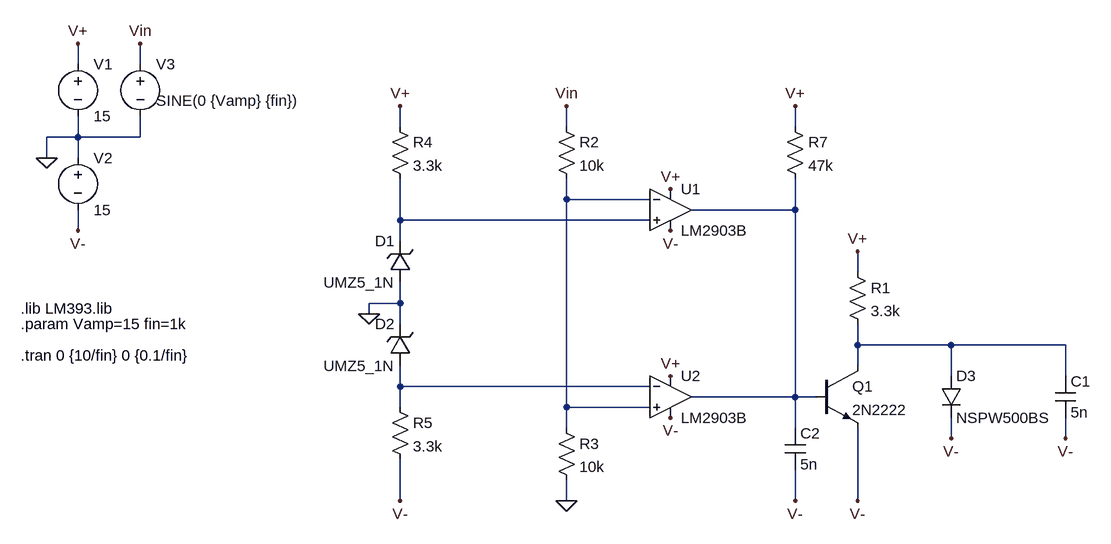
[diagram p0: schematic ClippingLed.asc]
ClippingLed.asc, the LTspice schematic file:
Version 4.1
SHEET 1 3588 2084
WIRE -832 16 -832 -16
WIRE -736 16 -736 -16
WIRE -336 112 -336 80
WIRE -80 112 -80 80
WIRE 272 112 272 80
WIRE -832 128 -832 96
WIRE -832 128 -880 128
WIRE -736 128 -736 96
WIRE -736 128 -832 128
WIRE -880 160 -880 128
WIRE -832 160 -832 128
WIRE -80 224 -80 192
WIRE 48 224 -80 224
WIRE 272 240 272 192
WIRE 272 240 112 240
WIRE -336 256 -336 192
WIRE 48 256 -336 256
WIRE -832 272 -832 240
WIRE -336 288 -336 256
WIRE 368 336 368 304
WIRE -336 384 -336 352
WIRE -336 384 -384 384
WIRE -384 400 -384 384
WIRE -336 416 -336 384
WIRE 368 448 368 416
WIRE 512 448 368 448
WIRE 688 448 512 448
WIRE 368 480 368 448
WIRE 512 496 512 448
WIRE 688 496 688 448
WIRE -336 512 -336 480
WIRE 48 512 -336 512
WIRE 272 528 272 240
WIRE 272 528 112 528
WIRE 304 528 272 528
WIRE -336 544 -336 512
WIRE -80 544 -80 224
WIRE 48 544 -80 544
WIRE -80 576 -80 544
WIRE 272 576 272 528
WIRE 512 592 512 560
WIRE 688 592 688 560
WIRE -336 688 -336 624
WIRE -80 688 -80 656
WIRE 272 688 272 640
WIRE 368 688 368 576
FLAG -832 -16 V+
FLAG -832 272 V-
FLAG -736 -16 Vin
FLAG -80 80 Vin
FLAG -880 160 0
FLAG 80 208 V+
FLAG 80 272 V-
FLAG 80 496 V+
FLAG 80 560 V-
FLAG -80 688 0
FLAG -336 80 V+
FLAG -336 688 V-
FLAG -384 400 0
FLAG 368 304 V+
FLAG 272 80 V+
FLAG 368 688 V-
FLAG 512 592 V-
FLAG 688 592 V-
FLAG 272 688 V-
SYMBOL voltage -832 0 R0
WINDOW 123 0 0 Left 0
WINDOW 39 0 0 Left 0
SYMATTR InstName V1
SYMATTR Value 15
SYMBOL voltage -832 144 R0
WINDOW 123 0 0 Left 0
WINDOW 39 0 0 Left 0
SYMATTR InstName V2
SYMATTR Value 15
SYMBOL voltage -736 0 R0
WINDOW 123 24 44 Left 2
WINDOW 39 0 0 Left 0
WINDOW 3 24 72 Left 2
SYMATTR Value SINE(0 {Vamp} {fin})
SYMATTR InstName V3
SYMBOL OpAmps\\opamp2 80 176 R0
SYMATTR InstName U1
SYMATTR Value LM2903B
SYMBOL OpAmps\\opamp2 80 464 R0
SYMATTR InstName U2
SYMATTR Value LM2903B
SYMBOL res -96 96 R0
SYMATTR InstName R2
SYMATTR Value 10k
SYMBOL res -96 560 R0
SYMATTR InstName R3
SYMATTR Value 10k
SYMBOL zener -320 352 R180
WINDOW 0 24 64 Left 2
WINDOW 3 24 0 Left 2
SYMATTR InstName D1
SYMATTR Value UMZ5_1N
SYMBOL res -352 96 R0
SYMATTR InstName R4
SYMATTR Value 3.3k
SYMBOL res -352 528 R0
SYMATTR InstName R5
SYMATTR Value 3.3k
SYMBOL zener -320 480 R180
WINDOW 0 24 64 Left 2
WINDOW 3 24 0 Left 2
SYMATTR InstName D2
SYMATTR Value UMZ5_1N
SYMBOL npn 304 480 R0
SYMATTR InstName Q1
SYMATTR Value 2N2222
SYMBOL diode 496 496 R0
SYMATTR InstName D3
SYMATTR Value NSPW500BS
SYMATTR Description Diode
SYMATTR Type diode
SYMBOL res 352 320 R0
SYMATTR InstName R1
SYMATTR Value 3.3k
SYMBOL res 256 96 R0
SYMATTR InstName R7
SYMATTR Value 47k
SYMBOL cap 672 496 R0
SYMATTR InstName C1
SYMATTR Value 5n
SYMBOL cap 256 576 R0
SYMATTR InstName C2
SYMATTR Value 5n
TEXT -920 416 Left 2 !.param Vamp=15 fin=1k
TEXT -920 464 Left 2 !.tran 0 {10/fin} 0 {0.1/fin}
TEXT -920 392 Left 2 !.lib LM393.lib

The netlist it stands for:
* ClippingLed.asc
V1 V+ 0 15
V2 0 V- 15
V3 Vin 0 SINE(0 {Vamp} {fin})
X§U1 N003 N001 V+ V- N002 LM2903B  ; pins In+ In- V+ V- OUT
X§U2 N001 N005 V+ V- N002 LM2903B  ; pins In+ In- V+ V- OUT
R2 Vin N001 10k
R3 N001 0 10k
D1 0 N003 UMZ5_1N
R4 V+ N003 3.3k
R5 N005 V- 3.3k
D2 N005 0 UMZ5_1N
Q1 N004 N002 V- 0 2N2222
D3 N004 V- NSPW500BS
R1 V+ N004 3.3k
R7 V+ N002 47k
C1 N004 V- 5n
C2 N002 V- 5n
.model D D
.lib standard.dio
.model NPN NPN
.model PNP PNP
.lib standard.bjt
.param Vamp=15 fin=1k
.tran 0 {10/fin} 0 {0.1/fin}
.lib LM393.lib
.backanno
.end